# Altium project Stepper_Breakout.PrjPcb (part 2 of 2)

## Sheet Current_Sense_Section.SchDoc: =Projectname
size A4; SheetNumber: 4; SheetTotal: 7
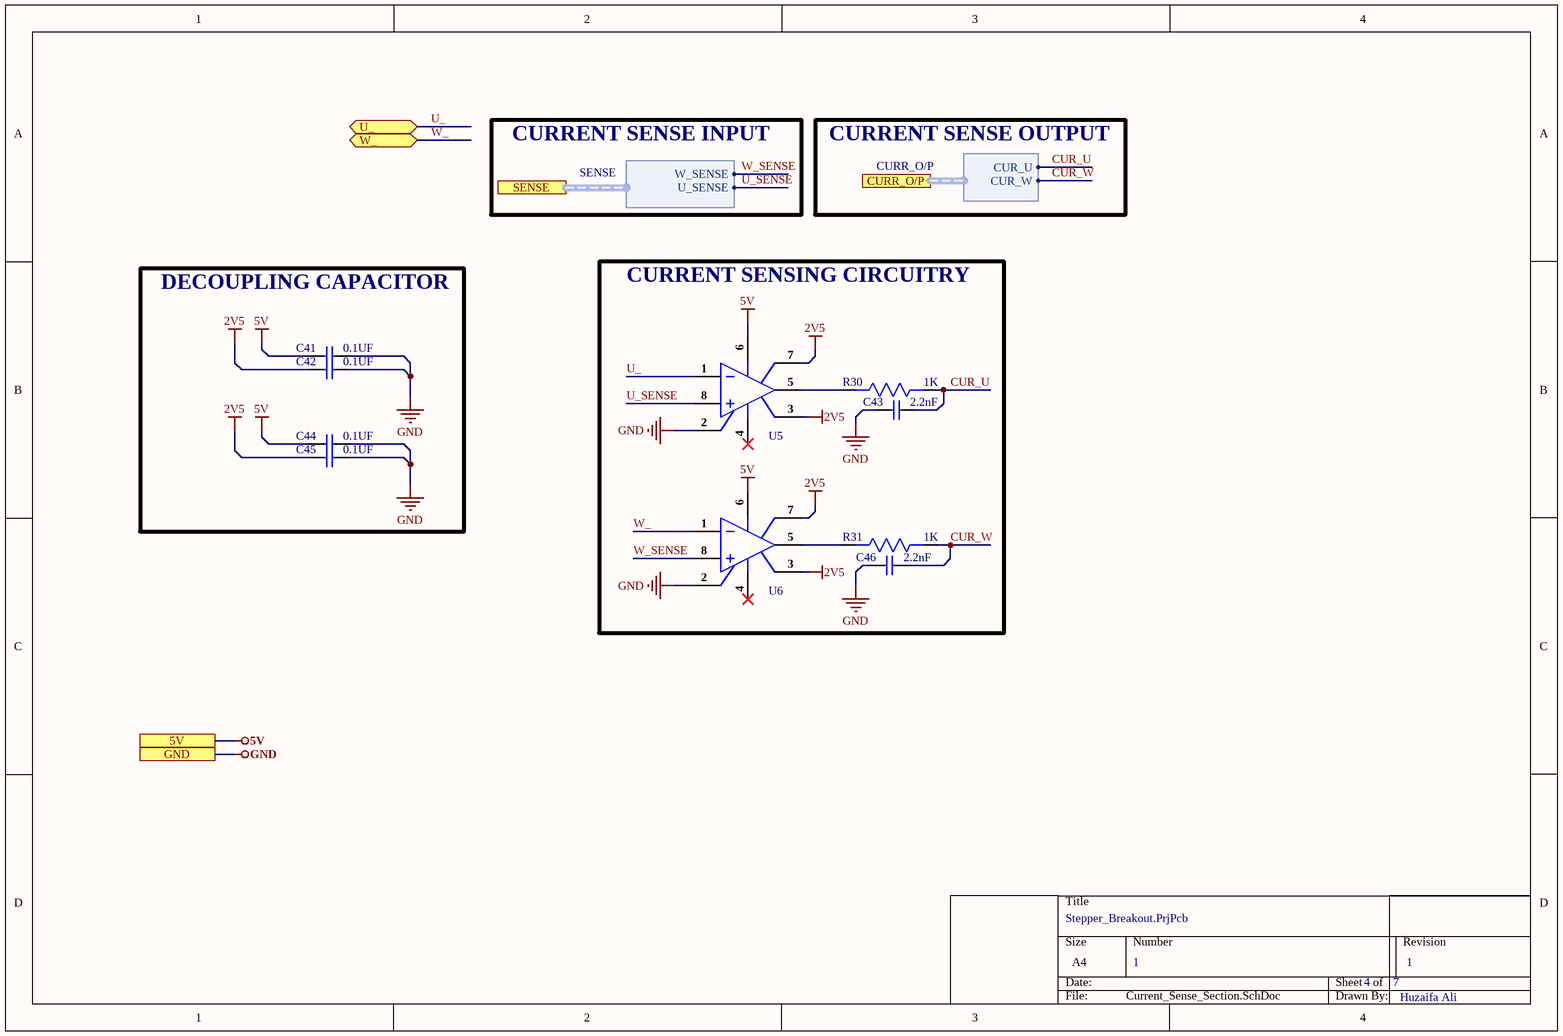
[diagram p3: Current_Sense_Section.SchDoc]

### Parts
C41  0.1UF  [Cap0402]
C42  0.1UF  [Cap0402]
C43  2.2nF  [Cap0603]
C44  0.1UF  [Cap0402]
C45  0.1UF  [Cap0402]
C46  2.2nF  [Cap0603]
R30  1K  [Res0603]
R31  1K  [Res0603]
U5  AD8418WBRZ-RL  [SOIC-8]  (value not drawn)
U6  AD8418WBRZ-RL  [SOIC-8]  (value not drawn)

### Blocks framed on the sheet
DECOUPLING CAPACITOR: C41 C42 C44 C45
CURRENT SENSING CIRCUITRY: C43 C46 R30 R31 U5 U6

### Ports
5V, CURR_O/P (harness CURR_O/P), GND, SENSE (harness SENSE), U_ (bidir), W_ (bidir)

### Harnesses
CURR_O/P: CUR_U, CUR_W
SENSE: W_SENSE, U_SENSE

### Nets
2V5: C42.1 C45.1 U5.3(VREF2) U5.7(VREF1) U6.3(VREF2) U6.7(VREF1)
5V: C41.1 C44.1 U5.6(VS) U6.6(VS) ; port 5V
GND: C41.2 C42.2 C43.1 C44.2 C45.2 C46.1 U5.2(GND) U6.2(GND) ; port GND
CUR_U: C43.2 R30.1 ; port CURR_O/P.CUR_U
CUR_W: C46.2 R31.1 ; port CURR_O/P.CUR_W
U_: U5.1(IN-) ; port U_
U_SENSE: U5.8(IN+) ; port SENSE.U_SENSE
W_: U6.1(IN-) ; port W_
W_SENSE: U6.8(IN+) ; port SENSE.W_SENSE
NetR30_2: R30.2 U5.5(OUT)
NetR31_2: R31.2 U6.5(OUT)

Not connected (* = marked no-connect by the designer): U5 4(NC)*; U6 4(NC)*

### Notes on the sheet
- CURRENT SENSE INPUT
- CURRENT SENSE OUTPUT
- 1
- Huzaifa Ali

### Library data of the parts
C41 C42 C44 C45 = CL05B104KB54PNC: CAP CER 0.1UF 50V X7R 0402; Manufacturer: Samsung; Supplier 1: Digi-Key; Manufacturer Part Number: CL05B104KB54PNC; Stock 1: 8594; Pricing 1: 1=0.1, 10=0.067, 50=0.0366, 100=0.0299, 500=0.02138, 1000=0.01681, 2500=0.01528, 5000=0.01406 (USD); Supplier Part Number 1: 1276-CL05B104KB54PNCDKR-ND
C43 C46 = CC0603KRX7R9BB222: CAP CER 2200PF 50V X7R 0603; Manufacturer: Yageo; Tolerance: 10%; Insulation Resistance: 10GR; Dissipation Factor: 2.5%; Supplier 1: Arrow Electronics; Manufacturer Part Number: CC0603KRX7R9BB222; RoHS: Yes; Category: Ceramic Capacitors; Stock 1: 84000; Pricing 1: 4000=0.01010, 8000=0.00890, 12000=0.00830, 40000=0.00750 (USD); Mount: Surface Mount; Case/Package: 0603; Number of Pins: 2; Case Code (Metric): 1608; Case Code (Imperial): 0603; Min Operating Temperature: -55°C; Max Operating Temperature: 125°C; Capacitance: 2.2nF; Dielectric: X7R; Package Quantity: 1; Voltage Rating: 50V; Packaging: Tape and Reel; Voltage Rating (DC): 50V; Termination: SMD/SMT; Resistor Type: Ceramic; Voltage: 50V; Series: CC; Length: 1.6mm; Width: 0.031inch; Height: 0.8mm; Thickness: 0.035inch; Depth: 0.8mm; Radiation Hardening: No; REACH SVHC: No SVHC; Lead Free: Lead Free; Halogen Free: Halogen Free; RoHS Compliant: Yes; ComponentLink1URL: https://datasheet.ciiva.com/23768/1079489-23768004.pdf?src-supplier=Newark; ComponentLink1Description: https://datasheet.ciiva.com/23768/1079489-23768004.pdf?src-supplier=Newark; ComponentLink2URL: https://datasheet.ciiva.com/11788/0900766b8079c870-11788403.pdf?src-supplier=RSComponents; ComponentLink2Description: https://datasheet.ciiva.com/11788/0900766b8079c870-11788403.pdf?src-supplier=RSComponents; ComponentLink3URL: https://datasheet.ciiva.com/26862/getdatasheetpartid-403587-26862854.pdf?src-supplier=Verical; ComponentLink3Description: https://datasheet.ciiva.com/26862/getdatasheetpartid-403587-26862854.pdf?src-supplier=Verical; ComponentLink4URL: https://datasheet.ciiva.com/8033/70765-8033863.pdf?src-supplier=Element14; ComponentLink4Description: https://datasheet.ciiva.com/8033/70765-8033863.pdf?src-supplier=Element14; ComponentLink5URL: https://datasheet.ciiva.com/7978/1489800-7978172.pdf?src-supplier=Element14; ComponentLink5Description: https://datasheet.ciiva.com/7978/1489800-7978172.pdf?src-supplier=Element14; ComponentLink6URL: https://datasheet.ciiva.com/28450/1489800-28450632.pdf?src-supplier=Element14; ComponentLink6Description: https://datasheet.ciiva.com/28450/1489800-28450632.pdf?src-supplier=Element14; ComponentLink7URL: https://datasheet.ciiva.com/155/mlccorderingcode-155921.pdf?src-supplier=Digi-Key; ComponentLink7Description: https://datasheet.ciiva.com/155/mlccorderingcode-155921.pdf?src-supplier=Digi-Key; ComponentLink8URL: https://datasheet.ciiva.com/155/mlccorderingcode-155920.pdf?src-supplier=Digi-Key; ComponentLink8Description: https://datasheet.ciiva.com/155/mlccorderingcode-155920.pdf?src-supplier=Digi-Key; ComponentLink9URL: https://datasheet.ciiva.com/155/mlccorderingcode-155922.pdf?src-supplier=Digi-Key; ComponentLink9Description: https://datasheet.ciiva.com/155/mlccorderingcode-155922.pdf?src-supplier=Digi-Key; ComponentLink10URL: https://datasheet.ciiva.com/8033/1489800-8033864.pdf?src-supplier=Element14; ComponentLink10Description: https://datasheet.ciiva.com/8033/1489800-8033864.pdf?src-supplier=Element14; ComponentLink11URL: https://datasheet.ciiva.com/8033/1489800-8033862.pdf?src-supplier=Element14; ComponentLink11Description: https://datasheet.ciiva.com/8033/1489800-8033862.pdf?src-supplier=Element14; Supplier Part Number 1: CC0603KRX7R9BB222
R30 R31 = RC0603FR-071KL: RES SMD 1K OHM 1% 1/10W 0603; Manufacturer: Yageo; Resistance: 1kR; Temperature Coefficient: 100ppm/°C; Power Rating: 100mW; Voltage Rating: 50V; ComponentLink1URL: https://www.verical.com/server-webapp/html/getDatasheet?partID=409289&src-supplier=Verical; ComponentLink1Description: https://www.verical.com/server-webapp/html/getDatasheet?partID=409289&src-supplier=Verical; Supplier 1: Digi-Key; Manufacturer Part Number: RC0603FR-071KL; Stock 1: 21472395; Pricing 1: 1=0.1, 10=0.023, 100=0.0094, 1000=0.0042, 2500=0.0037 (USD); Case/Package: 0603; Contact Plating: Tin,Matte; Case Code (Imperial): 0603; Case Code (Metric): 1608; Min Operating Temperature: -55°C; Max Operating Temperature: 155°C; Tolerance: 1%; Composition: Thick Film; Packaging: Tape and Reel; Termination: SMD/SMT; Military Standard: Not; Length: 1.6mm; Height: 0.45mm; Depth: 0.8mm; Radiation Hardening: No; REACH SVHC: No SVHC; Lead Free: Lead Free; ComponentLink2URL: http://documents.rs-components.com/techlib://itc_doclist_GB.htm?stockno=5048928&src-supplier=RSComponents; ComponentLink2Description: http://documents.rs-components.com/techlib://itc_doclist_GB.htm?stockno=5048928&src-supplier=RSComponents; ComponentLink3URL: http://www.yageo.com/documents/recent/PYu-RC0603_51_RoHS_L_4.pdf?src-supplier=Avnet+Europe; ComponentLink3Description: http://www.yageo.com/documents/recent/PYu-RC0603_51_RoHS_L_4.pdf?src-supplier=Avnet+Europe; ComponentLink4URL: http://www.farnell.com/datasheets/2167052.pdf?src-supplier=Element14; ComponentLink4Description: http://www.farnell.com/datasheets/2167052.pdf?src-supplier=Element14; ComponentLink5URL: http://www.farnell.com/datasheets/1868787.pdf?src-supplier=Element14; ComponentLink5Description: http://www.farnell.com/datasheets/1868787.pdf?src-supplier=Element14; ComponentLink6URL: http://www.yageo.com/documents/recent/PYu-RC_Group_51_RoHS_L_2.pdf?src-supplier=Avnet; ComponentLink6Description: http://www.yageo.com/documents/recent/PYu-RC_Group_51_RoHS_L_2.pdf?src-supplier=Avnet; ComponentLink7URL: https://www.verical.com/server-webapp/html/getDatasheet?partID=404327&src-supplier=Verical; ComponentLink7Description: https://www.verical.com/server-webapp/html/getDatasheet?partID=404327&src-supplier=Verical; ComponentLink8URL: http://www.farnell.com/datasheets/443971.pdf?src-supplier=Element14; ComponentLink8Description: http://www.farnell.com/datasheets/443971.pdf?src-supplier=Element14; Supplier Part Number 1: 311-1.00KHRDKR-ND
U5 U6 = AD8418WBRZ-RL: IC CURRENT SENSE 1 CIRCUIT 8SOIC; Manufacturer: Analog Devices; Input Capacitance: 2pF; Common Mode Rejection Ratio: 90dB; Min Supply Voltage: 2.7V; Max Supply Voltage: 5.5V; Min Dual Supply Voltage: 1.35V; Max Dual Supply Voltage: 2.75V; Number of Circuits: 1; Slew Rate: 1V/µs; -3db Bandwidth: 250kHz; Input Offset Voltage (Vos): 200uV; Operating Supply Current: 2.6mA; Power Supply Rejection Ratio (PSRR): 80dB; Supplier 1: Mouser; Manufacturer Part Number: AD8418WBRZ-RL; RoHS: Yes; Category: Power Management ICs; Pricing 1: 1=3.18000, 10=2.86000, 25=2.70000, 50=2.70000, 100=2.34000, 250=2.22000, 500=1.99000, 1000=1.70000, 2500=1.69000, 10000=1.69000 (USD); Mount: Surface Mount; Case/Package: SOIC; Number of Pins: 8; Contact Plating: Tin,Matte; Min Operating Temperature: -40°C; Max Operating Temperature: 125°C; Packaging: Tape and Reel; Lead Free: Contains Lead; ComponentLink1URL: https://datasheet.ciiva.com/30008/ad8418-30008109.pdf?src-supplier=Avnet; ComponentLink1Description: https://datasheet.ciiva.com/30008/ad8418-30008109.pdf?src-supplier=Avnet; Supplier Part Number 1: 584-AD8418WBRZ-RL

## Sheet MOSFET_Section.SchDoc
size A; SheetNumber: 5; SheetTotal: 7
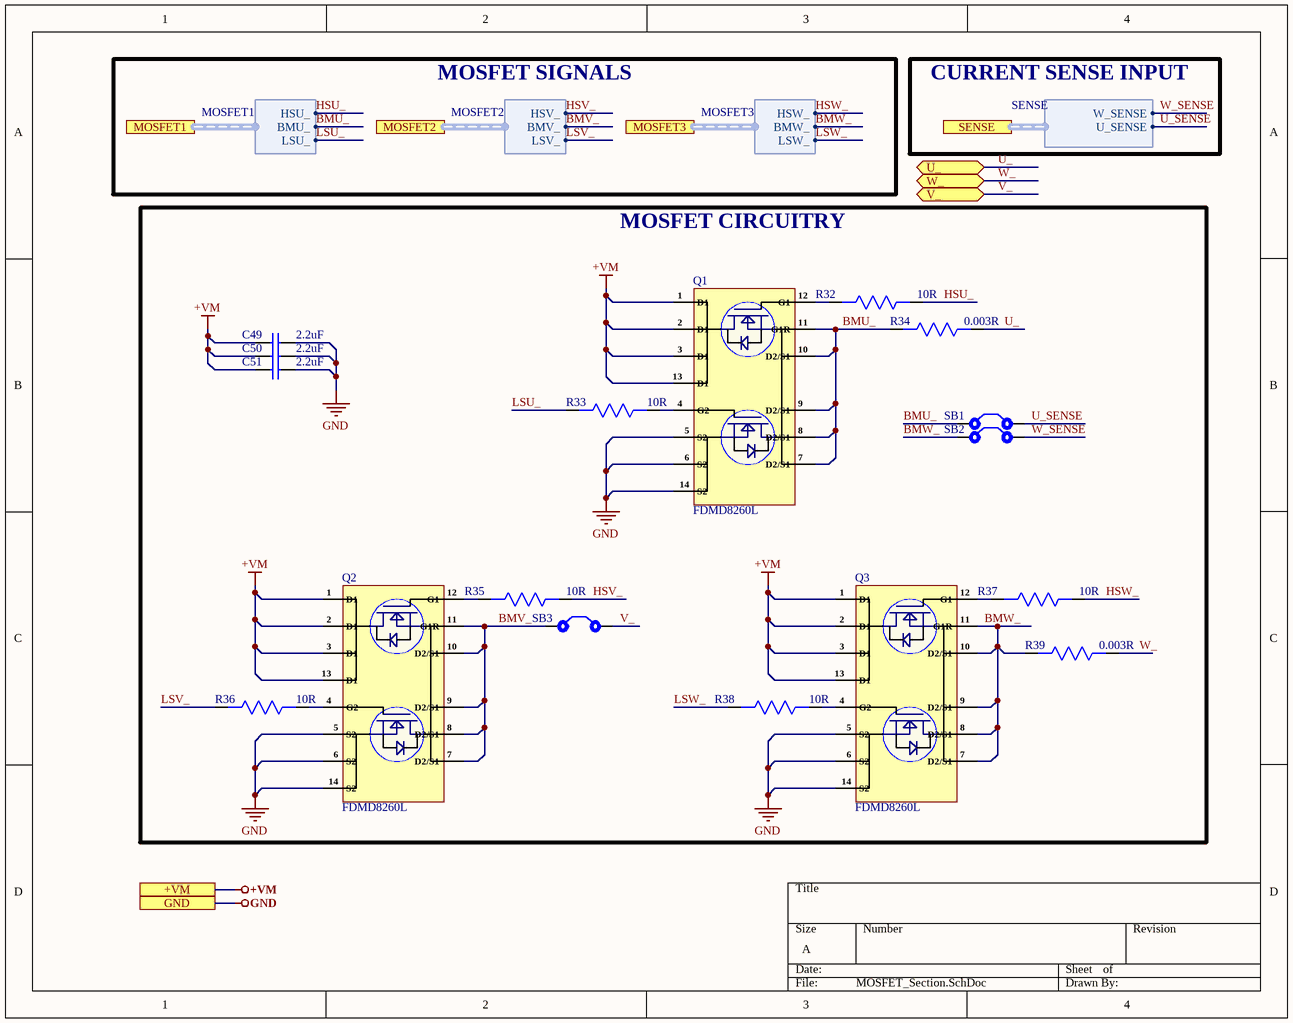
[diagram p4: MOSFET_Section.SchDoc]

### Parts
C49  2.2uF  [Cap0805]
C50  2.2uF  [Cap0805]
C51  2.2uF  [Cap0805]
Q1  FDMD8260L  [12-Power3.3x5]
Q2  FDMD8260L  [12-Power3.3x5]
Q3  FDMD8260L  [12-Power3.3x5]
R32  10R  [Res0603]
R33  10R  [Res0603]
R34  0.003R  [RES 2512]
R35  10R  [Res0603]
R36  10R  [Res0603]
R37  10R  [Res0603]
R38  10R  [Res0603]
R39  0.003R  [RES 2512]
SB1  Solder Bridge  [Solder Bridge]  (value not drawn)
SB2  Solder Bridge  [Solder Bridge]  (value not drawn)
SB3  Solder Bridge  [Solder Bridge]  (value not drawn)

### Blocks framed on the sheet
MOSFET CIRCUITRY: C49-C51 Q1-Q3 R32-R39 SB1-SB3

### Ports
+VM, GND, MOSFET1 (harness MOSFET1), MOSFET2 (harness MOSFET2), MOSFET3 (harness MOSFET3), SENSE (harness SENSE), U_ (bidir), V_ (bidir), W_ (bidir)

### Harnesses
MOSFET1: HSU_, BMU_, LSU_
MOSFET2: HSV_, BMV_, LSV_
MOSFET3: HSW_, BMW_, LSW_
SENSE: W_SENSE, U_SENSE

### Nets
+VM: C49.1 C50.1 C51.1 Q1.1(D1) Q1.2(D1) Q1.3(D1) Q1.13(D1) Q2.1(D1) Q2.2(D1) Q2.3(D1) Q2.13(D1) Q3.1(D1) Q3.2(D1) Q3.3(D1) Q3.13(D1) ; port +VM
GND: C49.2 C50.2 C51.2 Q1.5(S2) Q1.6(S2) Q1.14(S2) Q2.5(S2) Q2.6(S2) Q2.14(S2) Q3.5(S2) Q3.6(S2) Q3.14(S2) ; port GND
BMU_: Q1.7(D2/S1) Q1.8(D2/S1) Q1.9(D2/S1) Q1.10(D2/S1) Q1.11(G1R) R34.2 SB1.1 ; port MOSFET1.BMU_
BMV_: Q2.7(D2/S1) Q2.8(D2/S1) Q2.9(D2/S1) Q2.10(D2/S1) Q2.11(G1R) SB3.1 ; port MOSFET2.BMV_
BMW_: Q3.7(D2/S1) Q3.8(D2/S1) Q3.9(D2/S1) Q3.10(D2/S1) Q3.11(G1R) R39.2 SB2.1 ; port MOSFET3.BMW_
HSU_: R32.1 ; port MOSFET1.HSU_
HSV_: R35.1 ; port MOSFET2.HSV_
HSW_: R37.1 ; port MOSFET3.HSW_
LSU_: R33.2 ; port MOSFET1.LSU_
LSV_: R36.2 ; port MOSFET2.LSV_
LSW_: R38.2 ; port MOSFET3.LSW_
U_: R34.1 ; port U_
U_SENSE: SB1.2 ; port SENSE.U_SENSE
V_: SB3.2 ; port V_
W_: R39.1 ; port W_
W_SENSE: SB2.2 ; port SENSE.W_SENSE
NetQ1_4: Q1.4(G2) R33.1
NetQ1_12: Q1.12(G1) R32.2
NetQ2_4: Q2.4(G2) R36.1
NetQ2_12: Q2.12(G1) R35.2
NetQ3_4: Q3.4(G2) R38.1
NetQ3_12: Q3.12(G1) R37.2

### Notes on the sheet
- MOSFET SIGNALS
- CURRENT SENSE INPUT

### Library data of the parts
C49-C51 = GRM21BD72A225KE01L: CAP CER 2.2UF 100V X7T 0805; Manufacturer: Murata; Supplier 1: Digi-Key; Manufacturer Part Number: GRM21BD72A225KE01L; RoHS: No; Category: Ceramic Capacitors; Stock 1: 1904; Pricing 1: 1=0.57000, 10=0.40200, 50=0.30360, 100=0.26450, 500=0.19592, 1000=0.16654 (USD); RoHS Compliant: Yes; Supplier Part Number 1: 490-GRM21BD72A225KE01LCT-ND
Q1-Q3 = FDMD8260L: MOSFET 2N-CH 60V 15A 12POWER; Manufacturer: ON Semiconductor / Fairchild; Rds On Max: 5.8mR; Input Capacitance: 5.245nF; Max Power Dissipation: 1W; Element Configuration: Dual; FET Type: 2 N-Channel; Supplier 1: Newark; Manufacturer Part Number: FDMD8260L; RoHS: Yes; Category: MOSFETs; Pricing 1: 1=3.19000, 10=2.87000, 25=2.72000, 50=2.54000, 100=2.35000, 250=2.18000, 500=2.01000, 1000=1.76000 (USD); Mount: Surface Mount; Number of Pins: 12; Weight: 0.0823188g; Min Operating Temperature: -55°C; Max Operating Temperature: 150°C; Packaging: Tape and Reel; Drain to Source Voltage (Vdss): 60V; Continuous Drain Current (ID): 15A; RoHS Compliant: Yes; ComponentLink1URL: https://www.fairchildsemi.com/datasheets/FD/FDMD8260L.pdf?src-supplier=Digi-Key; ComponentLink1Description: https://www.fairchildsemi.com/datasheets/FD/FDMD8260L.pdf?src-supplier=Digi-Key; Supplier Part Number 1: 54AH8638
R32 R33 R35-R38 = RC0603FR-0710RL: RES SMD 10 OHM 1% 1/10W 0603; Manufacturer: Yageo; Temperature Coefficient: 200ppm/°C; Power Rating: 100mW; Voltage Rating: 50V; Supplier 1: Digi-Key; Manufacturer Part Number: RC0603FR-0710RL; Stock 1: 10836596; Pricing 1: 1=0.1, 10=0.046, 100=0.0187, 1000=0.0084, 2500=0.00729 (USD); Case/Package: 0603; Number of Pins: 2; Case Code (Imperial): 0603; Case Code (Metric): 1608; Contact Plating: Tin,Matte; Min Operating Temperature: -55°C; Max Operating Temperature: 155°C; Resistance: 10R; Tolerance: 1%; Composition: Thick Film; Packaging: Tape and Reel; Voltage Rating (DC): 50V; Termination: SMD/SMT; Military Standard: Not; Length: 1.6mm; Height: 0.45mm; Width: 0.8mm; Depth: 0.8mm; Radiation Hardening: No; Lead Free: Lead Free; REACH SVHC: No SVHC; ComponentLink1URL: http://www.farnell.com/datasheets/1868787.pdf?src-supplier=Element14; ComponentLink1Description: http://www.farnell.com/datasheets/1868787.pdf?src-supplier=Element14; ComponentLink2URL: http://www.yageo.com/documents/recent/PYu-RC0603_51_RoHS_L_4.pdf?src-supplier=Avnet; ComponentLink2Description: http://www.yageo.com/documents/recent/PYu-RC0603_51_RoHS_L_4.pdf?src-supplier=Avnet; ComponentLink3URL: http://documents.rs-components.com/techlib://itc_doclist_GB.htm?stockno=5048984&src-supplier=RSComponents; ComponentLink3Description: http://documents.rs-components.com/techlib://itc_doclist_GB.htm?stockno=5048984&src-supplier=RSComponents; ComponentLink4URL: http://www.yageo.com/documents/recent/PYu-RC0603_51_RoHS_L_4.pdf?src-supplier=Avnet+Europe; ComponentLink4Description: http://www.yageo.com/documents/recent/PYu-RC0603_51_RoHS_L_4.pdf?src-supplier=Avnet+Europe; Supplier Part Number 1: 311-10.0HRDKR-ND
R34 R39 = CRE2512-FZ-R003E-3: RES 0.003 OHM 1% 3W 2512; Manufacturer: Bourns; Temperature Coefficient: 75ppm/°C; Resistance: 3mR; Supplier 1: Arrow Electronics; Manufacturer Part Number: CRE2512-FZ-R003E-3; RoHS: No; Category: Chip SMD Resistors; Stock 1: 7276; Pricing 1: 1=0.51890, 10=0.41630, 25=0.38400, 100=0.30630, 250=0.29870, 500=0.29120, 1000=0.28360, 3000=0.27600, 6000=0.26850 (USD); Mount: Surface Mount; Case/Package: 2512; Case Code (Imperial): 2512; Case Code (Metric): 6432; Contact Plating: Tin; Min Operating Temperature: -55°C; Max Operating Temperature: 170°C; Features: Moisture Resistant,Automotive AEC-Q200; Resistor Type: Metal Film,Metal Alloy,Thick Film; Number of Terminations: 2; Termination: Solder; Max Power Dissipation: 3W; Power Rating: 3W; Tolerance: 1%; Packaging: Cut Tape; Length: 0.254inch; Width: 0.132inch; Height: 0.035inch; Depth: 3.35mm; REACH SVHC: No SVHC; ComponentLink1URL: https://datasheet.ciiva.com/46424/1838634-46424792.pdf?src-supplier=Element14; ComponentLink1Description: https://datasheet.ciiva.com/46424/1838634-46424792.pdf?src-supplier=Element14; ComponentLink2URL: https://datasheet.ciiva.com/46424/1838634-46424793.pdf?src-supplier=Element14; ComponentLink2Description: https://datasheet.ciiva.com/46424/1838634-46424793.pdf?src-supplier=Element14; ComponentLink3URL: https://datasheet.ciiva.com/48532/cre-48532221.pdf?src-supplier=Avnet; ComponentLink3Description: https://datasheet.ciiva.com/48532/cre-48532221.pdf?src-supplier=Avnet; Supplier Part Number 1: CRE2512-FZ-R003E-3
SB1-SB3 = Solder Bridge: Solder Bridge ON

## Sheet TMC4671_Section.SchDoc: =Projectname
size A4; SheetNumber: 2; SheetTotal: 7
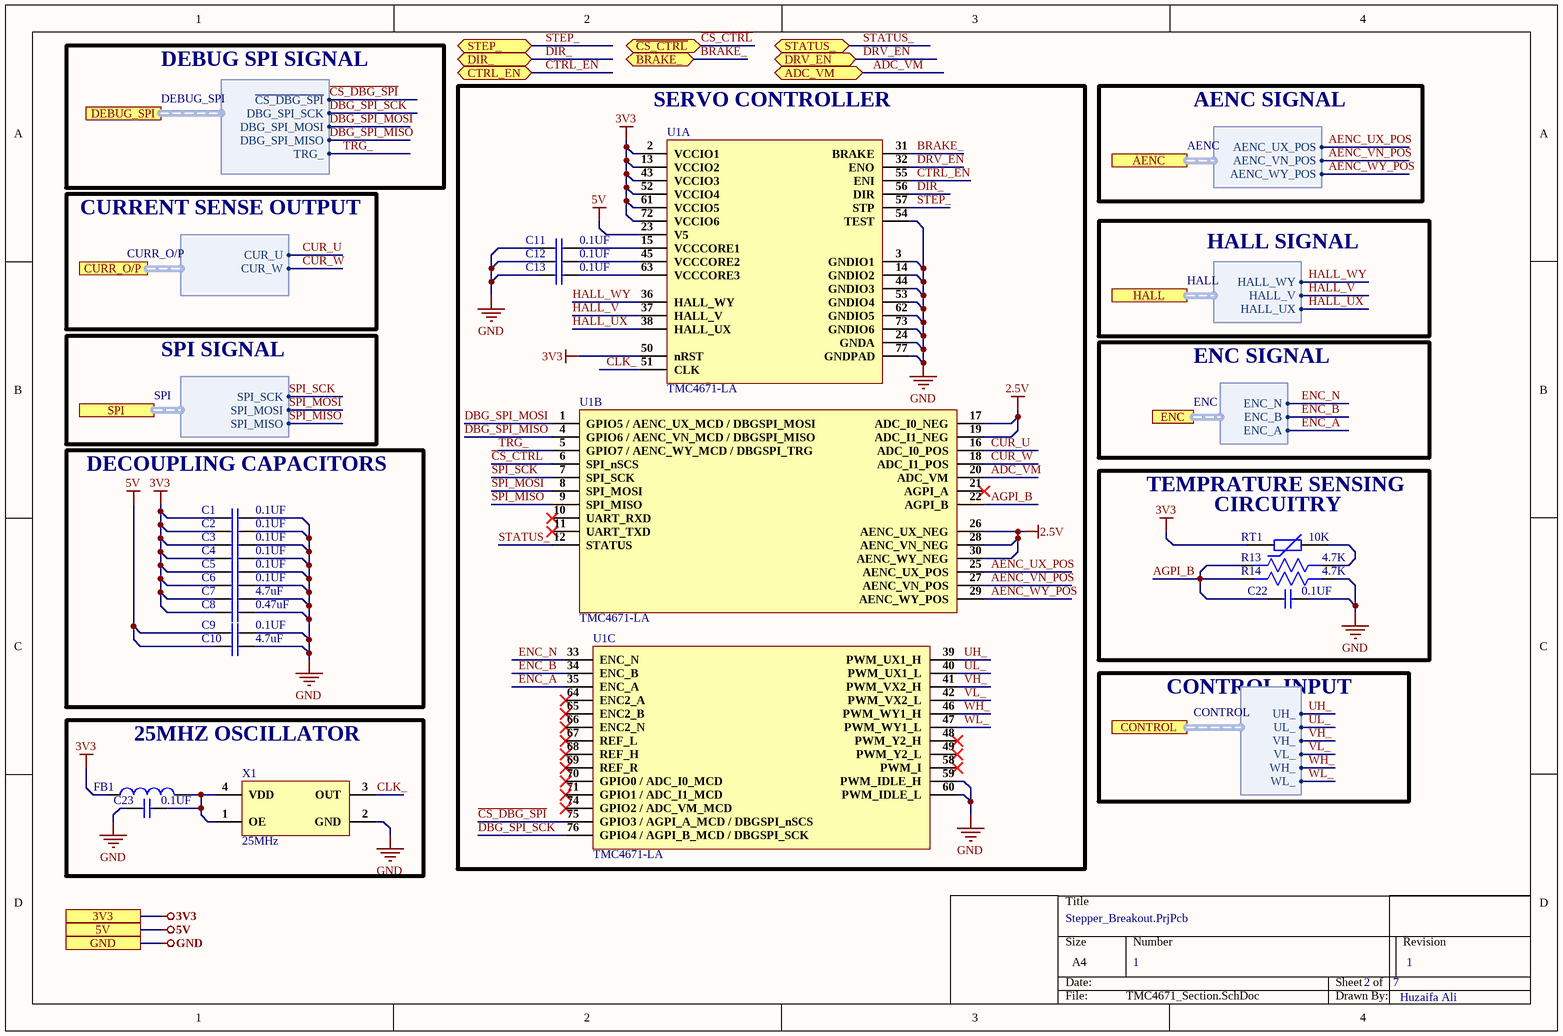
[diagram p5: TMC4671_Section.SchDoc]

### Parts
C1  0.1UF  [Cap0402]
C2  0.1UF  [Cap0402]
C3  0.1UF  [Cap0402]
C4  0.1UF  [Cap0402]
C5  0.1UF  [Cap0402]
C6  0.1UF  [Cap0402]
C7  4.7uF  [Cap0603]
C8  0.47uF  [Cap0603]
C9  0.1UF  [Cap0402]
C10  4.7uF  [Cap0603]
C11  0.1UF  [Cap0402]
C12  0.1UF  [Cap0402]
C13  0.1UF  [Cap0402]
C22  0.1UF  [Cap0402]
C23  0.1UF  [Cap0402]
FB1  742792651  [IND 0603]  (value not drawn)
R13  4.7K  [Res0603]
R14  4.7K  [Res0603]
RT1  10K  [Res0603]
U1  TMC4671-LA  [76-QFN (10.5x6.5)]  (parts A,B,C of 3)
X1  25MHz  [SX3M25.000M20F30TNN]

### Blocks framed on the sheet
SERVO CONTROLLER: C11-C13 U1
DECOUPLING CAPACITORS: C1-C10
25MHZ OSCILLATOR: C23 FB1 X1

### Ports
3V3, 5V, ADC_VM (bidir), AENC (harness AENC), BRAKE_ (bidir), CONTROL (harness CONTROL), CTRL_EN (bidir), CURR_O/P (harness CURR_O/P), DEBUG_SPI (harness DEBUG_SPI), DIR_ (bidir), DRV_EN (bidir), ENC (harness ENC), GND, HALL (harness HALL), SPI (harness SPI), STATUS_ (bidir), STEP_ (bidir), ~{CS_CTRL} (bidir)

### Harnesses
DEBUG_SPI: ~{CS_DBG_SPI}, DBG_SPI_SCK, DBG_SPI_MOSI, DBG_SPI_MISO, TRG_
SPI: SPI_SCK, SPI_MOSI, SPI_MISO
ENC: ENC_N, ENC_B, ENC_A
HALL: HALL_WY, HALL_V, HALL_UX
CURR_O/P: CUR_U, CUR_W
AENC: AENC_UX_POS, AENC_VN_POS, AENC_WY_POS
CONTROL: UH_, UL_, VH_, VL_, WH_, WL_

### Nets
2.5V: U1.17(ADC_I0_NEG) U1.19(ADC_I1_NEG) U1.26(AENC_UX_NEG) U1.28(AENC_VN_NEG) U1.30(AENC_WY_NEG)
3V3: C1.1 C2.1 C3.1 C4.1 C5.1 C6.1 C7.1 C8.1 FB1.1 RT1.1 U1.2(VCCIO1) U1.13(VCCIO2) U1.43(VCCIO3) U1.50(nRST) U1.52(VCCIO4) U1.61(VCCIO5) U1.72(VCCIO6) ; port 3V3
5V: C9.1 C10.1 U1.23(V5) ; port 5V
GND: C1.2 C2.2 C3.2 C4.2 C5.2 C6.2 C7.2 C8.2 C9.2 C10.2 C11.1 C12.1 C13.1 C22.2 C23.1 R14.1 U1.3(GNDIO1) U1.14(GNDIO2) U1.24(GNDA) U1.44(GNDIO3) U1.53(GNDIO4) U1.54(TEST) U1.59(PWM_IDLE_H) U1.60(PWM_IDLE_L) U1.62(GNDIO5) U1.73(GNDIO6) U1.77(GNDPAD) X1.2(GND) ; port GND
~{CS_CTRL}: U1.6(SPI_nSCS) ; port ~{CS_CTRL}
~{CS_DBG_SPI}: U1.75(GPIO3_/_AGPI_A_MCD_/_DBGSPI_nSCS) ; port DEBUG_SPI.~{CS_DBG_SPI}
ADC_VM: U1.20(ADC_VM) ; port ADC_VM
AENC_UX_POS: U1.25(AENC_UX_POS) ; port AENC.AENC_UX_POS
AENC_VN_POS: U1.27(AENC_VN_POS) ; port AENC.AENC_VN_POS
AENC_WY_POS: U1.29(AENC_WY_POS) ; port AENC.AENC_WY_POS
AGPI_B: C22.1 R13.2 R14.2 U1.22(AGPI_B)
BRAKE_: U1.31(BRAKE) ; port BRAKE_
CLK_: U1.51(CLK) X1.3(OUT)
CTRL_EN: U1.55(ENI) ; port CTRL_EN
CUR_U: U1.16(ADC_I0_POS) ; port CURR_O/P.CUR_U
CUR_W: U1.18(ADC_I1_POS) ; port CURR_O/P.CUR_W
DBG_SPI_MISO: U1.4(GPIO6_/_AENC_VN_MCD_/_DBGSPI_MISO) ; port DEBUG_SPI.DBG_SPI_MISO
DBG_SPI_MOSI: U1.1(GPIO5_/_AENC_UX_MCD_/_DBGSPI_MOSI) ; port DEBUG_SPI.DBG_SPI_MOSI
DBG_SPI_SCK: U1.76(GPIO4_/_AGPI_B_MCD_/_DBGSPI_SCK) ; port DEBUG_SPI.DBG_SPI_SCK
DIR_: U1.56(DIR) ; port DIR_
DRV_EN: U1.32(ENO) ; port DRV_EN
ENC_A: U1.35(ENC_A) ; port ENC.ENC_A  [project net ENC.ENC_A]
ENC_B: U1.34(ENC_B) ; port ENC.ENC_B  [project net ENC.ENC_B]
ENC_N: U1.33(ENC_N) ; port ENC.ENC_N  [project net ENC.ENC_N]
HALL_UX: U1.38(HALL_UX) ; port HALL.HALL_UX
HALL_V: U1.37(HALL_V) ; port HALL.HALL_V
HALL_WY: U1.36(HALL_WY) ; port HALL.HALL_WY
SPI_MISO: U1.9(SPI_MISO) ; port SPI.SPI_MISO  [project net SPI.SPI_MISO]
SPI_MOSI: U1.8(SPI_MOSI) ; port SPI.SPI_MOSI  [project net SPI.SPI_MOSI]
SPI_SCK: U1.7(SPI_SCK) ; port SPI.SPI_SCK  [project net SPI.SPI_SCK]
STATUS_: U1.12(STATUS) ; port STATUS_
STEP_: U1.57(STP) ; port STEP_
TRG_: U1.5(GPIO7_/_AENC_WY_MCD_/_DBGSPI_TRG) ; port DEBUG_SPI.TRG_
UH_: U1.39(PWM_UX1_H) ; port CONTROL.UH_
UL_: U1.40(PWM_UX1_L) ; port CONTROL.UL_
VH_: U1.41(PWM_VX2_H) ; port CONTROL.VH_
VL_: U1.42(PWM_VX2_L) ; port CONTROL.VL_
WH_: U1.46(PWM_WY1_H) ; port CONTROL.WH_
WL_: U1.47(PWM_WY1_L) ; port CONTROL.WL_
NetC11_2: C11.2 U1.15(VCCCORE1)
NetC12_2: C12.2 U1.45(VCCCORE2)
NetC13_2: C13.2 U1.63(VCCCORE3)
NetC23_2: C23.2 FB1.2 X1.1(OE) X1.4(VDD)
NetR13_1: R13.1 RT1.2

Not connected (* = marked no-connect by the designer): U1 10(UART_RXD)* 11(UART_TXD)* 21(AGPI_A)* 48(PWM_Y2_H)* 49(PWM_Y2_L)* 58(PWM_I)* 64(ENC2_A)* 65(ENC2_B)* 66(ENC2_N)* 67(REF_L)* 68(REF_H)* 69(REF_R)* 70(GPIO0_/_ADC_I0_MCD)* 71(GPIO1_/_ADC_I1_MCD)* 74(GPIO2_/_ADC_VM_MCD)*

### Notes on the sheet
- DEBUG SPI SIGNAL
- AENC SIGNAL
- CURRENT SENSE OUTPUT
- HALL SIGNAL
- SPI SIGNAL
- ENC SIGNAL
- TEMPRATURE SENSING
- (near RT1) CIRCUITRY
- CONTROL INPUT
- 1
- Huzaifa Ali

### Library data of the parts
C1-C6 C9 C11-C13 C22 C23 = CL05B104KB54PNC: as C41 on sheet Current_Sense_Section; Supplier 1: Digi-Key; Manufacturer Part Number: CL05B104KB54PNC; Stock 1: 8594; Pricing 1: 1=0.1, 10=0.067, 50=0.0366, 100=0.0299, 500=0.02138, 1000=0.01681, 2500=0.01528, 5000=0.01406 (USD); Supplier Part Number 1: 1276-CL05B104KB54PNCDKR-ND
C7 C10 = GRM188R61C475KAAJD: CAP CER 4.7UF 16V X5R 0603; Manufacturer: Murata; Material: Ceramic; Tolerance: 10%; Supplier 1: Digi-Key; Manufacturer Part Number: GRM188R61C475KAAJD; Stock 1: 407631; Pricing 1: 1=0.35, 10=0.246, 100=0.1473, 500=0.1105, 1000=0.09331 (USD); Mount: Surface Mount; Case/Package: 0603; Weight: 0.000222oz; Case Code (Metric): 1608; Case Code (Imperial): 0603; Min Operating Temperature: -55°C; Max Operating Temperature: 85°C; Capacitance: 4.7uF; Packaging: Tape and Reel; Dielectric: X5R; Voltage Rating: 16V; Termination: SMD/SMT; Voltage Rating (DC): 16V; Package Quantity: 4000; Length: 1.6mm; Height: 0.8mm; Width: 0.8mm; Thickness: 0.037inch; Depth: 0.8mm; REACH SVHC: No SVHC; Lead Free: Lead Free; ComponentLink1URL: http://components.arrow.com/part/dataview/50250782S9718068N2606?src-supplier=Arrow; ComponentLink1Description: http://components.arrow.com/part/dataview/50250782S9718068N2606?src-supplier=Arrow; Supplier Part Number 1: 490-10481-1-ND
C8 = UMK107B7474KA-TR: CAP CER 0.47uF 50V X7R 0603; Manufacturer: Taiyo Yuden; Tolerance: 10%; Capacitance: 470nF; Supplier 1: Digi-Key; Manufacturer Part Number: UMK107B7474KA-TR; RoHS: Yes; Category: Ceramic Capacitors; Stock 1: 81; Pricing 1: 1=0.21000, 10=0.14800, 50=0.08400, 100=0.06950, 500=0.04876, 1000=0.04036 (USD); Mount: Surface Mount; Case/Package: 0603; Case Code (Metric): 1608; Case Code (Imperial): 0603; Min Operating Temperature: -55°C; Max Operating Temperature: 125°C; Packaging: Tape and Reel; Voltage Rating: 50V; Package Quantity: 1; Dielectric: X7R; Termination: SMD/SMT; Voltage: 50V; Series: M; Voltage Rating (DC): 50V; Construction: Flat; Length: 1.6mm; Width: 0.031inch; Height: 0.8mm; Depth: 0.8mm; Thickness: 0.035inch; Radiation Hardening: No; RoHS Compliant: Yes; Lead Free: Lead Free; Halogen Free: Halogen Free; ComponentLink1URL: https://datasheet.ciiva.com/30063/972umk107b7474ka-tr-30063804.pdf?src-supplier=Onlinecomponents.com; ComponentLink1Description: https://datasheet.ciiva.com/30063/972umk107b7474ka-tr-30063804.pdf?src-supplier=Onlinecomponents.com; ComponentLink2URL: https://datasheet.ciiva.com/11600/umk107b7474ka-tr-ss-11600367.pdf?src-supplier=Avnet; ComponentLink2Description: https://datasheet.ciiva.com/11600/umk107b7474ka-tr-ss-11600367.pdf?src-supplier=Avnet; ComponentLink3URL: https://datasheet.ciiva.com/15922/257umk107b7474ka-tr-15922607.pdf?src-supplier=Onlinecomponents.com; ComponentLink3Description: https://datasheet.ciiva.com/15922/257umk107b7474ka-tr-15922607.pdf?src-supplier=Onlinecomponents.com; ComponentLink4URL: https://datasheet.ciiva.com/6274/mlcc-all-e-6274710.pdf?src-supplier=Digi-Key; ComponentLink4Description: https://datasheet.ciiva.com/6274/mlcc-all-e-6274710.pdf?src-supplier=Digi-Key; ComponentLink5URL: https://datasheet.ciiva.com/5412/mlcc01-e-5412119.pdf?src-supplier=Mouser; ComponentLink5Description: https://datasheet.ciiva.com/5412/mlcc01-e-5412119.pdf?src-supplier=Mouser; ComponentLink6URL: https://datasheet.ciiva.com/6274/mlcc-all-e-6274712.pdf?src-supplier=Digi-Key; ComponentLink6Description: https://datasheet.ciiva.com/6274/mlcc-all-e-6274712.pdf?src-supplier=Digi-Key; ComponentLink7URL: https://datasheet.ciiva.com/6274/mlcc-all-e-6274713.pdf?src-supplier=Digi-Key; ComponentLink7Description: https://datasheet.ciiva.com/6274/mlcc-all-e-6274713.pdf?src-supplier=Digi-Key; Supplier Part Number 1: 587-3170-1-ND
FB1 = 742792651: Ferrite Beads WE-CBF 0603 SMD Bead 100MHz 600Ohm 1000mA; Manufacturer: Wurth Electronics; Tolerance: 25%; Current Rating: 1A; Impedance: 600R; Number of Lines: 1; DC Resistance (DCR): 200mR; Inductance: 0.36H; Supplier 1: RSComponents; Manufacturer Part Number: 742792651; RoHS: Yes; Category: Ferrite Beads and Chips; Stock 1: 6200; Pricing 1: 50=0.13400, 500=0.12400, 2500=0.11200, 5000=0.10000, 12500=0.09000 (GBP); Mount: Surface Mount; Case/Package: SMD/SMT; Case Code (Metric): 1608; Case Code (Imperial): 0603; Material: Ferrite; Core Material: Ferrite; Weight: 0.000141oz; Min Operating Temperature: -55°C; Max Operating Temperature: 125°C; Package Quantity: 1; Packaging: Tape and Reel; Max Current Rating: 1A; Max DC Current: 1A; Termination: SMD/SMT; Test Frequency: 100MHz; Series: WE-CBF; Resistance: 200mR; Length: 1.6mm; Width: 0.8mm; Height: 0.8mm; Depth: 0.8mm; REACH SVHC: Unknown; RoHS Compliant: Yes; Lead Free: Lead Free; ComponentLink1URL: https://datasheet.ciiva.com/1475/1705833-1475349.pdf?src-supplier=Farnell; ComponentLink1Description: https://datasheet.ciiva.com/1475/1705833-1475349.pdf?src-supplier=Farnell; ComponentLink2URL: https://datasheet.ciiva.com/11803/0900766b80d2e079-11803680.pdf?src-supplier=RSComponents; ComponentLink2Description: https://datasheet.ciiva.com/11803/0900766b80d2e079-11803680.pdf?src-supplier=RSComponents; ComponentLink3URL: https://datasheet.ciiva.com/4940/742792651-72243-4940492.pdf?src-supplier=Mouser; ComponentLink3Description: https://datasheet.ciiva.com/4940/742792651-72243-4940492.pdf?src-supplier=Mouser; ComponentLink4URL: https://datasheet.ciiva.com/1013/742792651-1013527.pdf?src-supplier=Digi-Key; ComponentLink4Description: https://datasheet.ciiva.com/1013/742792651-1013527.pdf?src-supplier=Digi-Key; ComponentLink5URL: https://datasheet.ciiva.com/22711/1705833-22711420.pdf?src-supplier=Element14; ComponentLink5Description: https://datasheet.ciiva.com/22711/1705833-22711420.pdf?src-supplier=Element14; ComponentLink6URL: https://datasheet.ciiva.com/1013/742792651-1013528.pdf?src-supplier=Digi-Key; ComponentLink6Description: https://datasheet.ciiva.com/1013/742792651-1013528.pdf?src-supplier=Digi-Key; ComponentLink7URL: https://datasheet.ciiva.com/1013/742792651-1013529.pdf?src-supplier=Digi-Key; ComponentLink7Description: https://datasheet.ciiva.com/1013/742792651-1013529.pdf?src-supplier=Digi-Key; Supplier Part Number 1: 1241835
R13 R14 = RC0603FR-074K7L: RES SMD 4.7K OHM 1% 1/10W 0603; Manufacturer: Yageo; Resistance: 4.7kR; Temperature Coefficient: 100ppm/°C; Power Rating: 100mW; Voltage Rating (DC): 50V; Supplier 1: Digi-Key; Manufacturer Part Number: RC0603FR-074K7L; Stock 1: 5337567; Pricing 1: 1=0.1, 10=0.023, 100=0.0094, 1000=0.00421, 2500=0.00366 (USD); Case/Package: 0603; Number of Pins: 2; Case Code (Imperial): 0603; Case Code (Metric): 1608; Min Operating Temperature: -55°C; Max Operating Temperature: 155°C; Tolerance: 1%; Composition: Thick Film; Packaging: Tape and Reel; Voltage Rating: 50V; Termination: SMD/SMT; Military Standard: Not; Length: 1.6mm; Height: 0.45mm; Width: 0.8mm; Depth: 0.8mm; Lead Pitch: 0.3mm; REACH SVHC: No SVHC; Lead Free: Lead Free; ComponentLink1URL: https://www.verical.com/server-webapp/html/getDatasheet?partID=422754&src-supplier=Verical; ComponentLink1Description: https://www.verical.com/server-webapp/html/getDatasheet?partID=422754&src-supplier=Verical; ComponentLink2URL: http://www.farnell.com/datasheets/2167052.pdf?src-supplier=Element14; ComponentLink2Description: http://www.farnell.com/datasheets/2167052.pdf?src-supplier=Element14; ComponentLink3URL: http://www.farnell.com/datasheets/38590.pdf?src-supplier=Element14; ComponentLink3Description: http://www.farnell.com/datasheets/38590.pdf?src-supplier=Element14; ComponentLink4URL: http://www.farnell.com/datasheets/1868787.pdf?src-supplier=Element14; ComponentLink4Description: http://www.farnell.com/datasheets/1868787.pdf?src-supplier=Element14; Supplier Part Number 1: 311-4.70KHRCT-ND
RT1 = NCP18XH103F03RB: THERMISTOR NTC 10KOHM 3380K 0603; Manufacturer: Murata; Manufacturer Series: NCP18; Number of Terminals/Pins: 2; Resistance: 10kR; Tolerance: 1%; Power Rating: 100mW; Current Rating: 310uA; Accuracy: 0.7%; Thermistor Application: TEMPERATURE COMPENSATION; Supplier 1: Arrow Electronics; Manufacturer Part Number: NCP18XH103F03RB; RoHS: Yes; Category: Thermistors; Stock 1: 60000; Pricing 1: 4000=0.08160 (USD); Mount: Surface Mount; Case/Package: 0603; Number of Pins: 2; Case Code (Metric): 1608; Case Code (Imperial): 0603; Terminal Finish: Tin; Package Shape: Rectangular; Min Operating Temperature: -40°C; Max Operating Temperature: 125°C; Packaging: Tape and Reel; Package Quantity: 1; Termination: SMD/SMT; Max Power Dissipation: 100mW; Series: NCP; Resistance Tolerance: 1%; Terminal Placement: Dual; Length: 1.6mm; Height: 0.8mm; Depth: 0.8mm; Radiation Hardening: No; REACH SVHC: No SVHC; Lead Free: Lead Free; RoHS Compliant: Yes; ComponentLink1URL: https://datasheet.ciiva.com/11822/0900766b807f1e39-11822112.pdf?src-supplier=RSComponents; ComponentLink1Description: https://datasheet.ciiva.com/11822/0900766b807f1e39-11822112.pdf?src-supplier=RSComponents; ComponentLink2URL: https://datasheet.ciiva.com/4504/r44e-3685-4504704.pdf?src-supplier=Mouser; ComponentLink2Description: https://datasheet.ciiva.com/4504/r44e-3685-4504704.pdf?src-supplier=Mouser; ComponentLink3URL: https://datasheet.ciiva.com/2848/r44e-2848446.pdf?src-supplier=Digi-Key; ComponentLink3Description: https://datasheet.ciiva.com/2848/r44e-2848446.pdf?src-supplier=Digi-Key; ComponentLink4URL: https://datasheet.ciiva.com/2848/r44e-2848445.pdf?src-supplier=Digi-Key; ComponentLink4Description: https://datasheet.ciiva.com/2848/r44e-2848445.pdf?src-supplier=Digi-Key; ComponentLink5URL: https://datasheet.ciiva.com/2848/r44e-2848447.pdf?src-supplier=Digi-Key; ComponentLink5Description: https://datasheet.ciiva.com/2848/r44e-2848447.pdf?src-supplier=Digi-Key; ComponentLink6URL: https://datasheet.ciiva.com/3280/l0770e-3280679.pdf?src-supplier=Avnet; ComponentLink6Description: https://datasheet.ciiva.com/3280/l0770e-3280679.pdf?src-supplier=Avnet; ComponentLink7URL: https://datasheet.ciiva.com/16469/l0770e-16469741.pdf?src-supplier=Future+Electronics; ComponentLink7Description: https://datasheet.ciiva.com/16469/l0770e-16469741.pdf?src-supplier=Future+Electronics; ComponentLink8URL: https://datasheet.ciiva.com/17993/getdatasheetpartid-153236-17993210.pdf?src-supplier=Verical; ComponentLink8Description: https://datasheet.ciiva.com/17993/getdatasheetpartid-153236-17993210.pdf?src-supplier=Verical; Supplier Part Number 1: NCP18XH103F03RB
U1 = TMC4671-LA: SERVO CONTROLLER IC, QFN76; Manufacturer: Trinamic; Supplier 1: Mouser; Manufacturer Part Number: TMC4671-LA; RoHS: No; Category: Motor Drivers; Pricing 1: 1=12.54000, 10=11.53000, 25=11.05000, 50=11.05000, 100=9.26000, 261=8.66000, 522=8.05000, 1000=8.05000, 1044=7.64000, 10000=7.64000 (USD); Supplier Part Number 1: 700-TMC4671-LA
X1 = SX3M25.000M20F30TNN: 1.62V~3.63V -40℃~+85℃ 10mA ±20ppm CMOS 25MHz SMD3225-4P Oscillators ROHS; Manufacturer: SCTF Elec; ComponentLink1Description: LCSC; ComponentLink1URL: https://lcsc.com/product-detail/Oscillators_Shenzhen-SCTF-Elec-SX3M25-000M20F30TNN_C2901575.html; Manufacturer Part Number: SX3M25.000M20F30TNN; Footprint: Custom

## Sheet TMC6100_Section.SchDoc: =Projectname
size A4; SheetNumber: 3; SheetTotal: 7
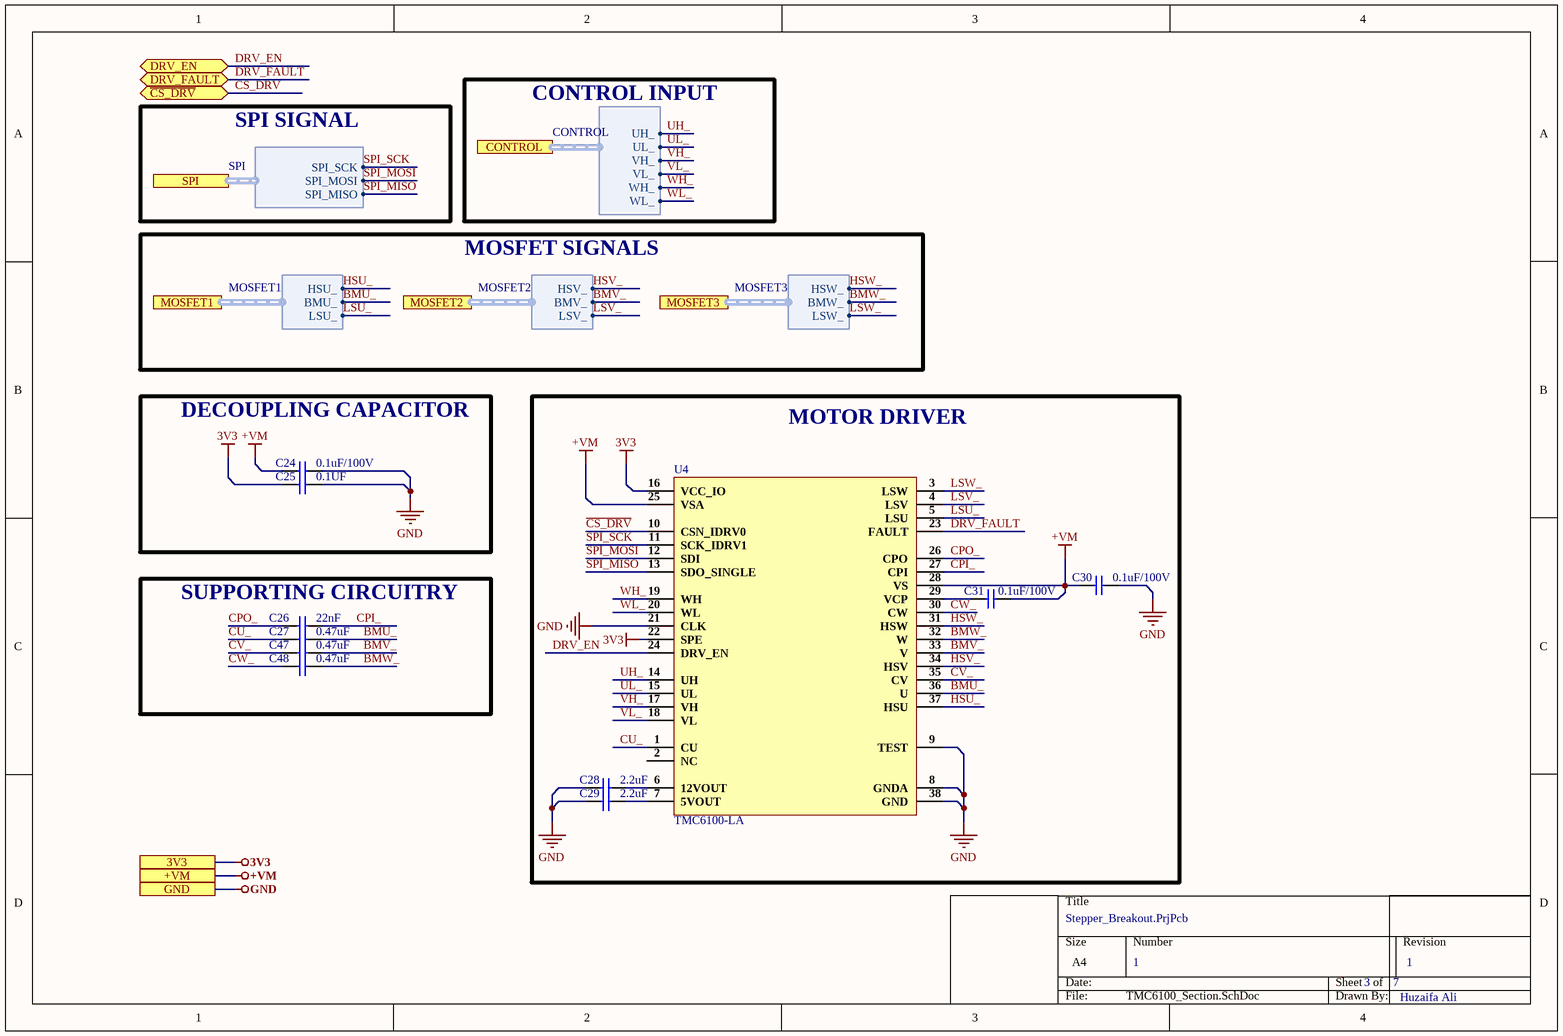
[diagram p6: TMC6100_Section.SchDoc]

### Parts
C24  0.1uF/100V  [Cap0603]
C25  0.1UF  [Cap0402]
C26  22nF  [Cap0603]
C27  0.47uF  [Cap0603]
C28  2.2uF  [Cap0603]
C29  2.2uF  [Cap0603]
C30  0.1uF/100V  [Cap0603]
C31  0.1uF/100V  [Cap0603]
C47  0.47uF  [Cap0603]
C48  0.47uF  [Cap0603]
U4  TMC6100-LA  [37-QFN-EP (7x7)]

### Blocks framed on the sheet
DECOUPLING CAPACITOR: C24 C25
MOTOR DRIVER: C28-C31 U4
SUPPORTING CIRCUITRY: C26 C27 C47 C48

### Ports
3V3, +VM, CONTROL (harness CONTROL), DRV_EN (bidir), DRV_FAULT (bidir), GND, MOSFET1 (harness MOSFET1), MOSFET2 (harness MOSFET2), MOSFET3 (harness MOSFET3), SPI (harness SPI), ~{CS_DRV} (bidir)

### Harnesses
SPI: SPI_SCK, SPI_MOSI, SPI_MISO
CONTROL: UH_, UL_, VH_, VL_, WH_, WL_
MOSFET1: HSU_, BMU_, LSU_
MOSFET2: HSV_, BMV_, LSV_
MOSFET3: HSW_, BMW_, LSW_

### Nets
3V3: C25.1 U4.16(VCC_IO) U4.22(SPE) ; port 3V3
+VM: C24.1 C30.1 C31.2 U4.25(VSA) U4.28(VS) ; port +VM
GND: C24.2 C25.2 C28.1 C29.1 C30.2 U4.8(GNDA) U4.9(TEST) U4.21(CLK) U4.38(GND) ; port GND
~{CS_DRV}: U4.10(CSN_IDRV0) ; port ~{CS_DRV}
BMU_: C27.2 U4.36(U) ; port MOSFET1.BMU_
BMV_: C47.2 U4.33(V) ; port MOSFET2.BMV_
BMW_: C48.2 U4.32(W) ; port MOSFET3.BMW_
CPI_: C26.2 U4.27(CPI)
CPO_: C26.1 U4.26(CPO)
CU_: C27.1 U4.1(CU)
CV_: C47.1 U4.35(CV)
CW_: C48.1 U4.30(CW)
DRV_EN: U4.24(DRV_EN) ; port DRV_EN
DRV_FAULT: U4.23(FAULT) ; port DRV_FAULT
HSU_: U4.37(HSU) ; port MOSFET1.HSU_
HSV_: U4.34(HSV) ; port MOSFET2.HSV_
HSW_: U4.31(HSW) ; port MOSFET3.HSW_
LSU_: U4.5(LSU) ; port MOSFET1.LSU_
LSV_: U4.4(LSV) ; port MOSFET2.LSV_
LSW_: U4.3(LSW) ; port MOSFET3.LSW_
SPI_MISO: U4.13(SDO_SINGLE) ; port SPI.SPI_MISO  [project net SPI.SPI_MISO]
SPI_MOSI: U4.12(SDI) ; port SPI.SPI_MOSI  [project net SPI.SPI_MOSI]
SPI_SCK: U4.11(SCK_IDRV1) ; port SPI.SPI_SCK  [project net SPI.SPI_SCK]
UH_: U4.14(UH) ; port CONTROL.UH_
UL_: U4.15(UL) ; port CONTROL.UL_
VH_: U4.17(VH) ; port CONTROL.VH_
VL_: U4.18(VL) ; port CONTROL.VL_
WH_: U4.19(WH) ; port CONTROL.WH_
WL_: U4.20(WL) ; port CONTROL.WL_
NetC28_2: C28.2 U4.6(12VOUT)
NetC29_2: C29.2 U4.7(5VOUT)
NetC31_1: C31.1 U4.29(VCP)

Not connected (* = marked no-connect by the designer): U4 2(NC)

### Notes on the sheet
- CONTROL INPUT
- SPI SIGNAL
- MOSFET SIGNALS
- 1
- Huzaifa Ali

### Library data of the parts
C24 C30 C31 = CC0603KRX7R0BB104: CAP CER 0.1UF 100V X7R 0603; Manufacturer: Yageo; Capacitance: 100nF; Tolerance: 10%; Supplier 1: Digi-Key; Manufacturer Part Number: CC0603KRX7R0BB104; RoHS: Yes; Category: Ceramic Capacitors; Stock 1: 60476; Pricing 1: 1=0.19000, 10=0.13500, 50=0.07680, 100=0.06370, 500=0.04466, 1000=0.03696 (USD); Mount: Surface Mount; Case/Package: 0603; Case Code (Metric): 1608; Case Code (Imperial): 0603; Weight: 7.1E-05oz; Min Operating Temperature: -55°C; Max Operating Temperature: 125°C; Package Quantity: 4000; Voltage Rating: 100V; Packaging: Tape and Reel; Dielectric: X7R; Termination: SMD/SMT; Resistor Type: Ceramic; Voltage Rating (DC): 100V; Series: CC; Length: 0.063inch; Width: 0.031inch; Thickness: 0.035inch; Depth: 0.8mm; Lead Free: Lead Free; RoHS Compliant: Yes; ComponentLink1URL: https://datasheet.ciiva.com/6277/mlccorderingcode-6277030.pdf?src-supplier=Digi-Key; ComponentLink1Description: https://datasheet.ciiva.com/6277/mlccorderingcode-6277030.pdf?src-supplier=Digi-Key; ComponentLink2URL: https://datasheet.ciiva.com/6277/mlccorderingcode-6277081.pdf?src-supplier=Digi-Key; ComponentLink2Description: https://datasheet.ciiva.com/6277/mlccorderingcode-6277081.pdf?src-supplier=Digi-Key; ComponentLink3URL: https://datasheet.ciiva.com/6277/mlccorderingcode-6277082.pdf?src-supplier=Digi-Key; ComponentLink3Description: https://datasheet.ciiva.com/6277/mlccorderingcode-6277082.pdf?src-supplier=Digi-Key; Supplier Part Number 1: 311-1523-1-ND
C25 = CL05B104KB54PNC: as C41 on sheet Current_Sense_Section; Supplier 1: Digi-Key; Manufacturer Part Number: CL05B104KB54PNC; Stock 1: 8594; Pricing 1: 1=0.1, 10=0.067, 50=0.0366, 100=0.0299, 500=0.02138, 1000=0.01681, 2500=0.01528, 5000=0.01406 (USD); Supplier Part Number 1: 1276-CL05B104KB54PNCDKR-ND
C26 = C0603C223K1RAC7867: CAP CER 22nF 100V X7R 0603; Manufacturer: KEMET; Manufacturer Part Number: C0603C223K1RACTU; Dielectric Material: Ceramic; Tolerance: 10%; Dissipation Factor: 2.5%; Supplier 1: Arrow Electronics; RoHS: Yes; Category: Ceramic Capacitors; Stock 1: 108000; Pricing 1: 4000=0.03660 (USD); Mount: Surface Mount,PCB; Case/Package: 0603; Number of Pins: 2; Case Code (Metric): 1608; Case Code (Imperial): 0603; Min Operating Temperature: -55°C; Max Operating Temperature: 125°C; Capacitance: 22nF; Dielectric: X7R; Package Quantity: 4000; Voltage Rating: 100V; Packaging: Tape and Reel; Voltage Rating (DC): 100V; Termination: SMD/SMT; Series: C; Construction: Flat; Voltage: 100V; Length: 1.6mm; Width: 0.031inch; Height: 0.8mm; Thickness: 0.034inch; Depth: 0.8mm; Lead Pitch: 0.7mm; Radiation Hardening: No; RoHS Compliant: Yes; REACH SVHC: No SVHC; ComponentLink1URL: https://datasheet.ciiva.com/5416/kem-c1002-x7r-smd-5416629.pdf?src-supplier=Mouser; ComponentLink1Description: https://datasheet.ciiva.com/5416/kem-c1002-x7r-smd-5416629.pdf?src-supplier=Mouser; ComponentLink2URL: https://datasheet.ciiva.com/18192/getdatasheetpartid-306025-18192903.pdf?src-supplier=Verical; ComponentLink2Description: https://datasheet.ciiva.com/18192/getdatasheetpartid-306025-18192903.pdf?src-supplier=Verical; ComponentLink3URL: https://datasheet.ciiva.com/18101/getdatasheetpartid-38414-18101194.pdf?src-supplier=Verical; ComponentLink3Description: https://datasheet.ciiva.com/18101/getdatasheetpartid-38414-18101194.pdf?src-supplier=Verical; Supplier Part Number 1: C0603C223K1RACTU
C27 C47 C48 = UMK107B7474KA-TR: as C8 on sheet TMC4671_Section; Supplier 1: Digi-Key; Manufacturer Part Number: UMK107B7474KA-TR; RoHS: Yes; Category: Ceramic Capacitors; Stock 1: 81; Pricing 1: 1=0.21000, 10=0.14800, 50=0.08400, 100=0.06950, 500=0.04876, 1000=0.04036 (USD); Mount: Surface Mount; Case/Package: 0603; Case Code (Metric): 1608; Case Code (Imperial): 0603; Min Operating Temperature: -55°C; Max Operating Temperature: 125°C; Packaging: Tape and Reel; Voltage Rating: 50V; Package Quantity: 1; Dielectric: X7R; Termination: SMD/SMT; Voltage: 50V; Series: M; Voltage Rating (DC): 50V; Construction: Flat; Length: 1.6mm; Width: 0.031inch; Height: 0.8mm; Depth: 0.8mm; Thickness: 0.035inch; Radiation Hardening: No; RoHS Compliant: Yes; Lead Free: Lead Free; Halogen Free: Halogen Free; ComponentLink1URL: https://datasheet.ciiva.com/30063/972umk107b7474ka-tr-30063804.pdf?src-supplier=Onlinecomponents.com; ComponentLink1Description: https://datasheet.ciiva.com/30063/972umk107b7474ka-tr-30063804.pdf?src-supplier=Onlinecomponents.com; ComponentLink2URL: https://datasheet.ciiva.com/11600/umk107b7474ka-tr-ss-11600367.pdf?src-supplier=Avnet; ComponentLink2Description: https://datasheet.ciiva.com/11600/umk107b7474ka-tr-ss-11600367.pdf?src-supplier=Avnet; ComponentLink3URL: https://datasheet.ciiva.com/15922/257umk107b7474ka-tr-15922607.pdf?src-supplier=Onlinecomponents.com; ComponentLink3Description: https://datasheet.ciiva.com/15922/257umk107b7474ka-tr-15922607.pdf?src-supplier=Onlinecomponents.com; ComponentLink4URL: https://datasheet.ciiva.com/6274/mlcc-all-e-6274710.pdf?src-supplier=Digi-Key; ComponentLink4Description: https://datasheet.ciiva.com/6274/mlcc-all-e-6274710.pdf?src-supplier=Digi-Key; ComponentLink5URL: https://datasheet.ciiva.com/5412/mlcc01-e-5412119.pdf?src-supplier=Mouser; ComponentLink5Description: https://datasheet.ciiva.com/5412/mlcc01-e-5412119.pdf?src-supplier=Mouser; ComponentLink6URL: https://datasheet.ciiva.com/6274/mlcc-all-e-6274712.pdf?src-supplier=Digi-Key; ComponentLink6Description: https://datasheet.ciiva.com/6274/mlcc-all-e-6274712.pdf?src-supplier=Digi-Key; ComponentLink7URL: https://datasheet.ciiva.com/6274/mlcc-all-e-6274713.pdf?src-supplier=Digi-Key; ComponentLink7Description: https://datasheet.ciiva.com/6274/mlcc-all-e-6274713.pdf?src-supplier=Digi-Key; Supplier Part Number 1: 587-3170-1-ND
C28 C29 = CL10A225KO8NNNC: CAP CER 2.2UF 16V X5R 0603; Manufacturer: Samsung; Material: Ceramic; Tolerance: 10%; Supplier 1: Digi-Key; Manufacturer Part Number: CL10A225KO8NNNC; Stock 1: 421786; Pricing 1: 1=0.13, 10=0.092, 100=0.0435, 500=0.03048, 1000=0.02524 (USD); Mount: Surface Mount; Case/Package: 0603; Case Code (Metric): 1608; Case Code (Imperial): 0603; Contact Plating: Tin; Min Operating Temperature: -55°C; Max Operating Temperature: 85°C; Capacitance: 2.2uF; Dielectric: X5R; Packaging: Tape and Reel; Package Quantity: 4000; Voltage Rating: 16V; Voltage: 16V; Voltage Rating (DC): 16V; Length: 1.6mm; Height: 0.8mm; Width: 0.031inch; Thickness: 0.035inch; Depth: 0.8mm; Radiation Hardening: No; Lead Free: Lead Free; ComponentLink1URL: https://www.verical.com/server-webapp/html/getDatasheet?partID=355165&src-supplier=Verical; ComponentLink1Description: https://www.verical.com/server-webapp/html/getDatasheet?partID=355165&src-supplier=Verical; ComponentLink2URL: http://www.samsungsem.com/kr/support/product-search/mlcc/__icsFiles/afieldfile/2016/08/18/S_CL10A225KO8NNNC.pdf?src-supplier=Digi-Key; ComponentLink2Description: http://www.samsungsem.com/kr/support/product-search/mlcc/__icsFiles/afieldfile/2016/08/18/S_CL10A225KO8NNNC.pdf?src-supplier=Digi-Key; ComponentLink3URL: http://www1.futureelectronics.com/doc/SAMSUNG%20PASSIVE/CL05B104KQ5NNNC.pdf?src-supplier=Future+Electronics; ComponentLink3Description: http://www1.futureelectronics.com/doc/SAMSUNG%20PASSIVE/CL05B104KQ5NNNC.pdf?src-supplier=Future+Electronics; ComponentLink4URL: https://produktinfo.conrad.com/datenblaetter/450000-474999/457919-da-01-en-VS_KONDENSATOR_0603.pdf?src-supplier=Conrad; ComponentLink4Description: https://produktinfo.conrad.com/datenblaetter/450000-474999/457919-da-01-en-VS_KONDENSATOR_0603.pdf?src-supplier=Conrad; Supplier Part Number 1: 1276-1040-1-ND
U4 = TMC6100-LA: GATE DRIVER IC 8-60V QFN37; Manufacturer: Trinamic; Supplier 1: Mouser; Manufacturer Part Number: TMC6100-LA; RoHS: No; Stock 1: 19; Pricing 1: 1=4.30000, 10=3.65000, 50=3.65000, 100=3.00000, 250=2.69000, 416=2.59000, 832=2.15000, 1000=2.15000, 2912=2.07000, 5408=2.00000, 10000=2.07000, 10400=1.95000 (USD); Supplier Part Number 1: 700-TMC6100LA

## Nets that join several sheets
2V5: Connector_Section (C39.1 R26.2 R27.2), Current_Sense_Section (6 pins)
3V3: Buffer_Section (C17.1 C21.1 U2.8 U3.8), Connector_Section (P3.1 P4.2), TMC4671_Section (17 pins), TMC6100_Section (C25.1 U4.16 U4.22)
5V: Buffer_Section (6 pins), Connector_Section (P4.1 R26.1), Current_Sense_Section (C41.1 C44.1 U5.6 U6.6), TMC4671_Section (C9.1 C10.1 U1.23)
+VM: Connector_Section (P6.1 P6.2 R28.1), MOSFET_Section (15 pins), TMC6100_Section (5 pins)
GND: Buffer_Section (10 pins), Connector_Section (20 pins), Current_Sense_Section (8 pins), MOSFET_Section (12 pins), TMC4671_Section (28 pins), TMC6100_Section (9 pins)
~{CS_CTRL}: Connector_Section (C32.1 R15.1), TMC4671_Section (U1.6)
~{CS_DBG_SPI}: Connector_Section (P3.3), TMC4671_Section (U1.75)
~{CS_DRV}: Connector_Section (C33.1 R16.1), TMC6100_Section (U4.10)
ADC_VM: Connector_Section (C40.1 R28.2 R29.2), TMC4671_Section (U1.20)
AENC_UX_POS: Connector_Section (P5.1), TMC4671_Section (U1.25)
AENC_VN_POS: Connector_Section (P5.2), TMC4671_Section (U1.27)
AENC_WY_POS: Connector_Section (P5.3), TMC4671_Section (U1.29)
BMU_: MOSFET_Section (7 pins), TMC6100_Section (C27.2 U4.36)
BMV_: MOSFET_Section (6 pins), TMC6100_Section (C47.2 U4.33)
BMW_: MOSFET_Section (7 pins), TMC6100_Section (C48.2 U4.32)
BRAKE_: Connector_Section (P8.1), TMC4671_Section (U1.31)
CTRL_EN: Connector_Section (C38.1 R23.2), TMC4671_Section (U1.55)
CUR_U: Current_Sense_Section (C43.2 R30.1), TMC4671_Section (U1.16)
CUR_W: Current_Sense_Section (C46.2 R31.1), TMC4671_Section (U1.18)
DBG_SPI_MISO: Connector_Section (P3.9), TMC4671_Section (U1.4)
DBG_SPI_MOSI: Connector_Section (P3.7), TMC4671_Section (U1.1)
DBG_SPI_SCK: Connector_Section (P3.5), TMC4671_Section (U1.76)
DIR_: Connector_Section (C37.1 R22.2), TMC4671_Section (U1.56)
DRV_EN: TMC4671_Section (U1.32), TMC6100_Section (U4.24)
DRV_FAULT: Connector_Section (R25.2), TMC6100_Section (U4.23)
ENC.ENC_A: Buffer_Section (U3.7), TMC4671_Section (U1.35)
ENC.ENC_B: Buffer_Section (U3.5), TMC4671_Section (U1.34)
ENC.ENC_N: Buffer_Section (U3.2), TMC4671_Section (U1.33)
ENC_A#: Buffer_Section (R7.1 R8.1), Connector_Section (P8.4)
ENC_B#: Buffer_Section (R9.1 R10.1), Connector_Section (P8.3)
ENC_IN.ENC_N#: Buffer_Section (R11.1 R12.1), Connector_Section (P8.2)
HALL_IN.HALL_UX#: Buffer_Section (R1.1 R2.1), Connector_Section (P1.2)
HALL_IN.HALL_V#: Buffer_Section (R3.1 R4.1), Connector_Section (P1.1)
HALL_IN.HALL_WY#: Buffer_Section (R5.1 R6.1), Connector_Section (P8.5)
HALL_UX: Buffer_Section (U2.7), TMC4671_Section (U1.38)
HALL_V: Buffer_Section (U2.5), TMC4671_Section (U1.37)
HALL_WY: Buffer_Section (U2.2), TMC4671_Section (U1.36)
HSU_: MOSFET_Section (R32.1), TMC6100_Section (U4.37)
HSV_: MOSFET_Section (R35.1), TMC6100_Section (U4.34)
HSW_: MOSFET_Section (R37.1), TMC6100_Section (U4.31)
LSU_: MOSFET_Section (R33.2), TMC6100_Section (U4.5)
LSV_: MOSFET_Section (R36.2), TMC6100_Section (U4.4)
LSW_: MOSFET_Section (R38.2), TMC6100_Section (U4.3)
SPI.SPI_MISO: Connector_Section (R19.1), TMC4671_Section (U1.9), TMC6100_Section (U4.13)
SPI.SPI_MOSI: Connector_Section (C35.1 R18.1), TMC4671_Section (U1.8), TMC6100_Section (U4.12)
SPI.SPI_SCK: Connector_Section (C34.1 R17.1), TMC4671_Section (U1.7), TMC6100_Section (U4.11)
STATUS_: Connector_Section (R20.2 R24.2), TMC4671_Section (U1.12)
STEP_: Connector_Section (C36.1 R21.2), TMC4671_Section (U1.57)
TRG_: Connector_Section (P3.4), TMC4671_Section (U1.5)
U_: Connector_Section (P2.2 P2.3), Current_Sense_Section (U5.1), MOSFET_Section (R34.1)
U_SENSE: Current_Sense_Section (U5.8), MOSFET_Section (SB1.2)
UH_: TMC4671_Section (U1.39), TMC6100_Section (U4.14)
UL_: TMC4671_Section (U1.40), TMC6100_Section (U4.15)
V_: Connector_Section (P2.4 P2.5), MOSFET_Section (SB3.2)
VH_: TMC4671_Section (U1.41), TMC6100_Section (U4.17)
VL_: TMC4671_Section (U1.42), TMC6100_Section (U4.18)
W_: Connector_Section (P2.6 P2.7), Current_Sense_Section (U6.1), MOSFET_Section (R39.1)
W_SENSE: Current_Sense_Section (U6.8), MOSFET_Section (SB2.2)
WH_: TMC4671_Section (U1.46), TMC6100_Section (U4.19)
WL_: TMC4671_Section (U1.47), TMC6100_Section (U4.20)